# Altium schematic sheet Sensor-Sheet.SchDoc
size A4; SheetNumber: 4; SheetTotal: 8
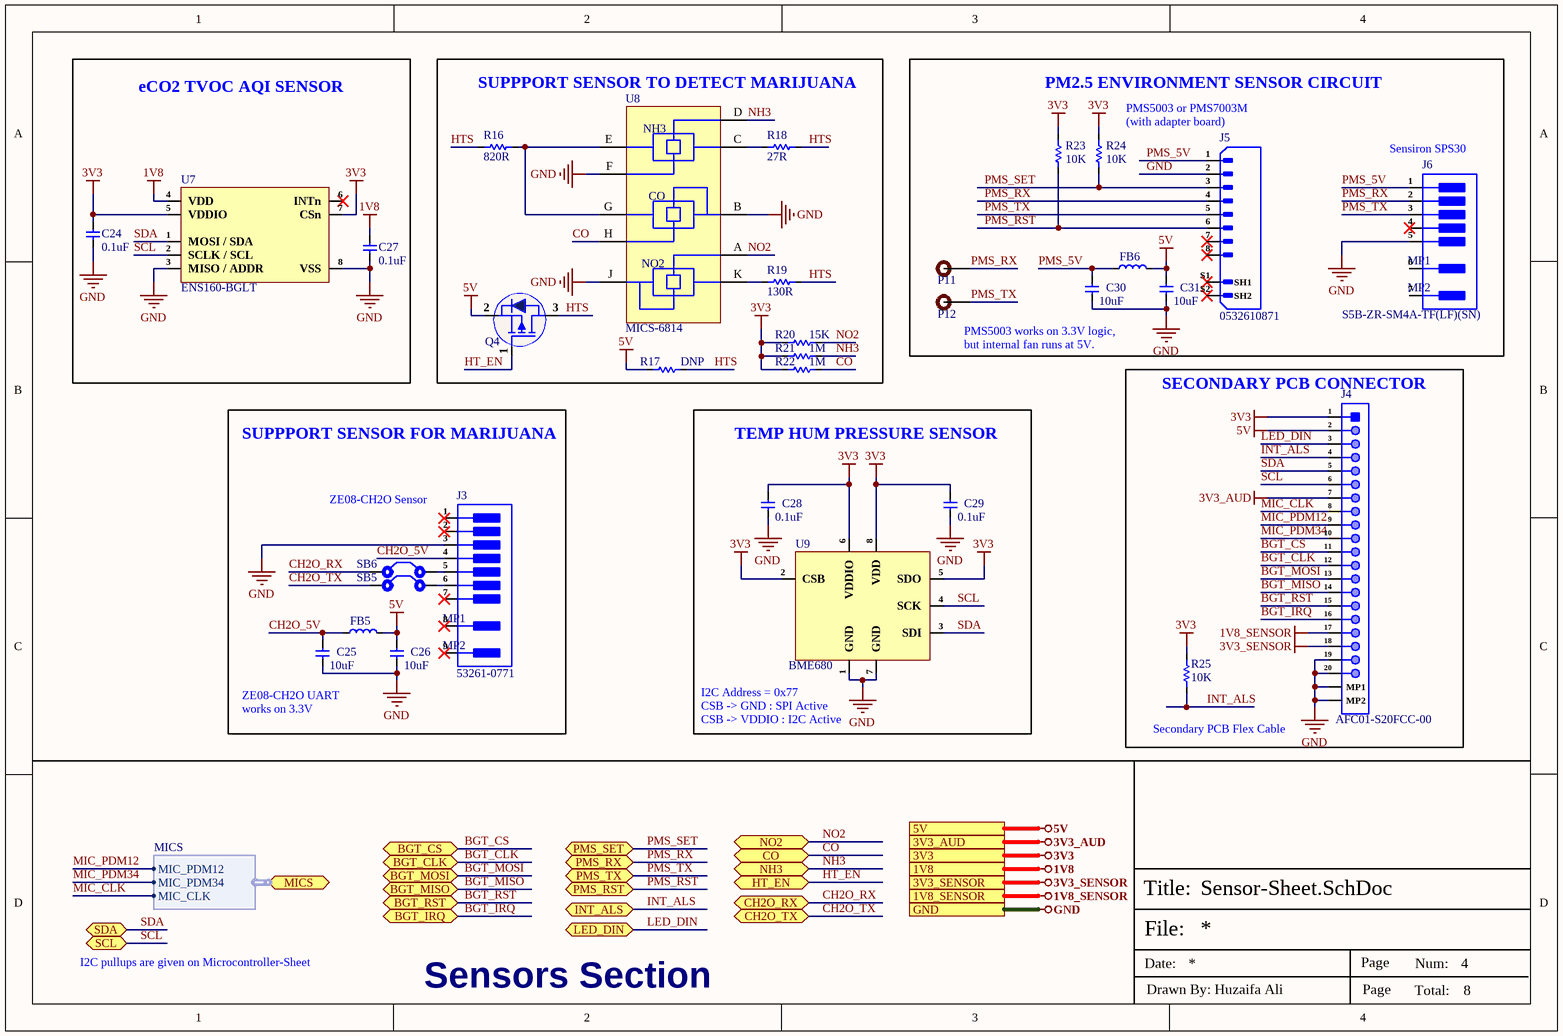
[diagram p0: Sensor-Sheet.SchDoc]

## Parts
C24  0.1uF  [Cap-0402]
C25  10uF  [Cap-0402]
C26  10uF  [Cap-0402]
C27  0.1uF  [Cap-0402]
C28  0.1uF  [Cap-0402]
C29  0.1uF  [Cap-0402]
C30  10uF  [Cap-0402]
C31  10uF  [Cap-0402]
FB5  BLM18SG121TN1D  [IND-0603 (1608 Metric)]  (value not drawn)
FB6  BLM18SG121TN1D  [IND-0603 (1608 Metric)]  (value not drawn)
J3  53261-0771  [53261-0771]
J4  AFC01-S20FCC-00  [AFC01-S20FCC-00]
J5  0532610871  [53261-0871]
J6  S5B-ZR-SM4A-TF(LF)(SN)  [S5B-ZR-SM4A-TF(LF)(SN)]
P11  TEST POINT  [Test-point]  (value not drawn)
P12  TEST POINT  [Test-point]  (value not drawn)
Q4  WPM2015-3/TR  [Sot-23]  (value not drawn)
R16  820R  [Res-0603]
R17  DNP  [Res-0603]
R18  27R  [Res-0603]
R19  130R  [Res-0603]
R20  15K  [Res-0603]
R21  1M  [Res-0603]
R22  1M  [Res-0603]
R23  10K  [Res-0402]
R24  10K  [Res-0402]
R25  10K  [Res-0402]
SB5  Solder Bridge 0402  [Solder Bridge 0402]  (value not drawn)
SB6  Solder Bridge 0402  [Solder Bridge 0402]  (value not drawn)
U7  ENS160-BGLT  [ENS160-BGLT]
U8  MICS-6814  [MICS-6814]
U9  BME680  [BME680]

## Blocks framed on the sheet
eCO2 TVOC AQI SENSOR: C24 C27 U7
SUPPPORT SENSOR TO DETECT MARIJUANA: Q4 R16-R22 U8
PM2.5 ENVIRONMENT SENSOR CIRCUIT: C30 C31 FB6 J5 J6 P11 P12 R23 R24
SUPPPORT SENSOR FOR MARIJUANA: C25 C26 FB5 J3 SB5 SB6
TEMP HUM PRESSURE SENSOR: C28 C29 U9
SECONDARY PCB CONNECTOR: J4 R25

## Ports
1V8, 1V8_SENSOR, 3V3, 3V3_AUD, 3V3_SENSOR, 5V, BGT_CLK (bidir), BGT_CS (bidir), BGT_IRQ (bidir), BGT_MISO (bidir), BGT_MOSI (bidir), BGT_RST (bidir), CH2O_RX (bidir), CH2O_TX (bidir), CO (bidir), GND, HT_EN (bidir), INT_ALS (bidir), LED_DIN (bidir), MICS (bidir, harness MICS), NH3 (bidir), NO2 (bidir), PMS_RST (bidir), PMS_RX (bidir), PMS_SET (bidir), PMS_TX (bidir), SCL (bidir), SDA (bidir)

## Harnesses
MICS: MIC_PDM12, MIC_CLK, MIC_PDM34

## Nets
1V8: C27.1 U7.4(VDD) ; port 1V8
1V8_SENSOR: J4.17 ; port 1V8_SENSOR
3V3: C24.1 C28.2 C29.2 J4.1 R20.1 R21.1 R22.1 R23.2 R24.2 R25.2 U7.5(VDDIO) U7.7(CSn) U9.2(CSB) U9.5(SDO) U9.6(VDDIO) U9.8(VDD) ; port 3V3
3V3_AUD: J4.7 ; port 3V3_AUD
3V3_SENSOR: J4.18 ; port 3V3_SENSOR
5V: C26.2 C31.2 FB5.2 FB6.2 J4.2 Q4.2(S) R17.1 ; port 5V
GND: C24.2 C25.1 C26.1 C27.2 C28.1 C29.1 C30.1 C31.1 J3.3 J4.19 J4.20 J4.MP1 J4.MP2 J5.2 J6.5 U7.3(MISO_/_ADDR) U7.8(VSS) U8.B(Rh1_RED/Rs1_RED) U8.F(Rs2_NH3) U8.J(Rh1_OX/Rs1_OX) U9.1(GND) U9.7(GND) ; port GND
BGT_CLK: J4.12 ; port BGT_CLK
BGT_CS: J4.11 ; port BGT_CS
BGT_IRQ: J4.16 ; port BGT_IRQ
BGT_MISO: J4.14 ; port BGT_MISO
BGT_MOSI: J4.13 ; port BGT_MOSI
BGT_RST: J4.15 ; port BGT_RST
CH2O_5V: C25.2 FB5.1 J3.4
CH2O_RX: SB6.1 ; port CH2O_RX
CH2O_TX: SB5.1 ; port CH2O_TX
CO: R22.2 U8.H(Rs2_RED) ; port CO
HT_EN: Q4.1(G) ; port HT_EN
HTS: Q4.3(D) R16.1 R17.2 R18.2 R19.2
INT_ALS: J4.4 R25.1 ; port INT_ALS
LED_DIN: J4.3 ; port LED_DIN
MIC_CLK: J4.8 ; port MICS.MIC_CLK
MIC_PDM12: J4.9 ; port MICS.MIC_PDM12
MIC_PDM34: J4.10 ; port MICS.MIC_PDM34
NH3: R21.2 U8.D(Rs1_NH3) ; port NH3
NO2: R20.2 U8.A(Rs2) ; port NO2
PMS_5V: C30.2 FB6.1 J5.1 J6.1
PMS_RST: J5.6 R23.1 ; port PMS_RST
PMS_RX: J5.4 J6.2 P11.1 ; port PMS_RX
PMS_SET: J5.3 R24.1 ; port PMS_SET
PMS_TX: J5.5 J6.3 P12.1 ; port PMS_TX
SCL: J4.6 U7.2(SCLK_/_SCL) U9.4(SCK) ; port SCL
SDA: J4.5 U7.1(MOSI_/_SDA) U9.3(SDI) ; port SDA
NetJ3_5: J3.5 SB6.2
NetJ3_6: J3.6 SB5.2
NetR16_2: R16.2 U8.E(Rh2_NH3) U8.G(Rh2_RED)
NetR18_1: R18.1 U8.C(Rh1_NH3)
NetR19_1: R19.1 U8.K(Rh2_OX)

Not connected (* = marked no-connect by the designer): J3 1* 2* 7* 8(MP1)* 9(MP2)*; J5 7* 8* S1(SH1)* S2(SH2)*; J6 4* 6(MP1) 7(MP2); U7 6(INTn)*

## Notes on the sheet
- PMS5003 or PMS7003M (with adapter board)
- (near J6) Sensiron SPS30
- PMS5003 works on 3.3V logic, but internal fan runs at 5V.
- (near J3) ZE08-CH2O Sensor
- (near C25) ZE08-CH2O UART works on 3.3V
- (near U9) CSB -> GND : SPI Active
- (near U9) I2C Address = 0x77
- CSB -> VDDIO : I2C Active
- (near R25) Secondary PCB Flex Cable
- I2C pullups are given on Microcontroller-Sheet
- Sensors Section
- File:
- Title:
- Date:
- Page
- Num:
- Total:
- Drawn By: Huzaifa Ali
- (in symbol MICS-6814) NH3; CO; NO2

## Library data of the parts
C24 C27-C29 = C1005X5R1H104K050BB: CAP CER 0.1UF 50V X5R 0402; Manufacturer: TDK; Dielectric Material: Ceramic; Capacitance: 100nF; Tolerance: 10%; Supplier 1: Digi-Key; Manufacturer Part Number: C1005X5R1H104K050BB; Stock 1: 1455182; Pricing 1: 1=0.12, 10=0.09, 50=0.049, 100=0.04, 500=0.02858, 1000=0.02245, 2500=0.02041, 5000=0.01878 (USD); Mount: Surface Mount; Case/Package: 0402; Case Code (Metric): 1005; Case Code (Imperial): 0402; Weight: 2.3E-05oz; Min Operating Temperature: -55°C; Max Operating Temperature: 85°C; Dielectric: X5R; Voltage Rating: 50V; Packaging: Tape and Reel; Voltage Rating (DC): 50V; Termination: SMD/SMT; Construction: Flat; Package Quantity: 1; Resistor Type: Ceramic; Voltage: 50V; Series: C; Length: 1mm; Width: 0.02inch; Height: 0.5mm; Depth: 0.5mm; Thickness: 0.022inch; Radiation Hardening: No; Lead Free: Lead Free; REACH SVHC: No SVHC; RoHS Compliant: Yes; ComponentLink1URL: https://product.tdk.com/info/en/catalog/spec/mlccspec_commercial_general_midvoltage_en.pdf?src-supplier=Digi-Key; ComponentLink1Description: https://product.tdk.com/info/en/catalog/spec/mlccspec_commercial_general_midvoltage_en.pdf?src-supplier=Digi-Key; ComponentLink2URL: http://www.tdk.co.jp/tefe02/e413_c.pdf?src-supplier=Future+Electronics; ComponentLink2Description: http://www.tdk.co.jp/tefe02/e413_c.pdf?src-supplier=Future+Electronics; ComponentLink3URL: https://www.verical.com/server-webapp/html/getDatasheet?partID=743571&src-supplier=Verical; ComponentLink3Description: https://www.verical.com/server-webapp/html/getDatasheet?partID=743571&src-supplier=Verical; ComponentLink4URL: http://www.tdk.co.jp/tefe02/e412_c.pdf?src-supplier=Avnet+Europe; ComponentLink4Description: http://www.tdk.co.jp/tefe02/e412_c.pdf?src-supplier=Avnet+Europe; Supplier Part Number 1: 445-5942-1-ND; LCSC Part Number: C2181865
C25 C26 C30 C31 = CC0402MRX5R6BB106: CAP CER 10UF 10V X5R 0402; Manufacturer: Yageo; Tolerance: 20%; Item Type: Capacitor; Supplier 1: Future Electronics; Manufacturer Part Number: CC0402MRX5R6BB106; RoHS: Yes; Category: Ceramic Capacitors; Stock 1: 80000; Pricing 1: 10000=0.02650, 20000=0.02590, 30000=0.02550, 40000=0.02530, 50000=0.02450 (USD); Mount: Surface Mount; Case/Package: 0402; Case Code (Imperial): 0402; Case Code (Metric): 1005; Min Operating Temperature: -55°C; Max Operating Temperature: 85°C; Packaging: Tape and Reel; Capacitance: 10uF; Voltage Rating: 10V; RoHS Compliant: Yes; ComponentLink1URL: http://www.yageo.com/documents/recent/UPY-GPHC_X5R_4V-to-50V_25.pdf?src-supplier=Digi-Key; ComponentLink1Description: http://www.yageo.com/documents/recent/UPY-GPHC_X5R_4V-to-50V_25.pdf?src-supplier=Digi-Key; Supplier Part Number 1: 6097631; LCSC Part Number: C962143
FB5 FB6 = BLM18SG121TN1D: FERRITE BEAD 120 OHM 0603 1LN; Manufacturer: Murata; Material: Steel,Ferrite; Tolerance: 25%; Impedance: 120R; DC Resistance (DCR): 25mR; Max DC Current: 3A; Number of Lines: 1; Test Frequency: 100MHz; Shielding: Unshielded; Supplier 1: Arrow Electronics; Manufacturer Part Number: BLM18SG121TN1D; RoHS: Yes; Category: Ferrite Beads and Chips; Stock 1: 82612; Pricing 1: 1=0.12640, 10=0.08350, 25=0.07210, 100=0.05150, 250=0.04730, 500=0.04110, 1000=0.03420, 3000=0.03360, 6000=0.03320, 15000=0.03270, 30000=0.03200, 75000=0.03150 (USD); Case/Package: 0603; Number of Pins: 2; Core Material: Ferrite; Case Code (Metric): 1608; Case Code (Imperial): 0603; Min Operating Temperature: -55°C; Max Operating Temperature: 125°C; Package Quantity: 1; Max Current Rating: 3A; Packaging: Tape and Reel; Current Rating: 3A; Termination: SMD/SMT; Frequency: 100MHz; Number of Circuits: 1; Series: BLM18S; DC Resistance-Max: 25mR; Length: 1.6mm; Width: 0.8mm; Height: 0.8mm; Depth: 0.8mm; Reach SVHC Compliant: Yes; Lead Free: Lead Free; RoHS Compliant: Yes; ComponentLink1URL: https://datasheet.ciiva.com/1012/l0110s0100blm18s-1012624.pdf?src-supplier=Digi-Key; ComponentLink1Description: https://datasheet.ciiva.com/1012/l0110s0100blm18s-1012624.pdf?src-supplier=Digi-Key; ComponentLink2URL: https://datasheet.ciiva.com/11799/0900766b811b5866-11799181.pdf?src-supplier=RSComponents; ComponentLink2Description: https://datasheet.ciiva.com/11799/0900766b811b5866-11799181.pdf?src-supplier=RSComponents; ComponentLink3URL: https://datasheet.ciiva.com/18093/getdatasheetpartid-295885-18093249.pdf?src-supplier=Verical; ComponentLink3Description: https://datasheet.ciiva.com/18093/getdatasheetpartid-295885-18093249.pdf?src-supplier=Verical; ComponentLink4URL: https://datasheet.ciiva.com/41449/001171723-da-01-en-chip-drossel0603-120r-3000ma-1-6x0-8mm-41449353.pdf?src-supplier=Conrad; ComponentLink4Description: https://datasheet.ciiva.com/41449/001171723-da-01-en-chip-drossel0603-120r-3000ma-1-6x0-8mm-41449353.pdf?src-supplier=Conrad; ComponentLink5URL: https://datasheet.ciiva.com/41449/001172312-da-01-en-drossel-0603-120r-1-6x0-8mm-10000st-41449675.pdf?src-supplier=Conrad; ComponentLink5Description: https://datasheet.ciiva.com/41449/001172312-da-01-en-drossel-0603-120r-1-6x0-8mm-10000st-41449675.pdf?src-supplier=Conrad; ComponentLink6URL: https://datasheet.ciiva.com/8021/5151-8021511.pdf?src-supplier=Element14; ComponentLink6Description: https://datasheet.ciiva.com/8021/5151-8021511.pdf?src-supplier=Element14; ComponentLink7URL: https://datasheet.ciiva.com/8021/5151-8021512.pdf?src-supplier=Element14; ComponentLink7Description: https://datasheet.ciiva.com/8021/5151-8021512.pdf?src-supplier=Element14; ComponentLink8URL: https://datasheet.ciiva.com/14122/blm-series-eng-tds-14122906.pdf?src-supplier=Distrelec; ComponentLink8Description: https://datasheet.ciiva.com/14122/blm-series-eng-tds-14122906.pdf?src-supplier=Distrelec; ComponentLink9URL: https://datasheet.ciiva.com/1012/l0110s0100blm18s-1012623.pdf?src-supplier=Digi-Key; ComponentLink9Description: https://datasheet.ciiva.com/1012/l0110s0100blm18s-1012623.pdf?src-supplier=Digi-Key; ComponentLink10URL: https://datasheet.ciiva.com/1012/l0110s0100blm18s-1012625.pdf?src-supplier=Digi-Key; ComponentLink10Description: https://datasheet.ciiva.com/1012/l0110s0100blm18s-1012625.pdf?src-supplier=Digi-Key; ComponentLink11URL: https://datasheet.ciiva.com/16395/l0110s0100blm18s-16395498.pdf?src-supplier=Future+Electronics; ComponentLink11Description: https://datasheet.ciiva.com/16395/l0110s0100blm18s-16395498.pdf?src-supplier=Future+Electronics; Supplier Part Number 1: BLM18SG121TN1D; LCSC Part Number: C113030; Item Type: Ferrite Bead
J3 = 53261-0771: CONN HEADER SMD R/A 7POS 1.25MM; Manufacturer: Molex; Body Plating: Tin; Contact Resistance: 20mR; Number of Contacts: 7; Current Rating: 1A; Voltage Rating: 125V; Insulation Resistance: 100MR; Item Type: Wire To Wire Connector; Supplier 1: Mouser; Manufacturer Part Number: 53261-0771; RoHS: Yes; Category: Headers and Wire Housings; Stock 1: 27199; Pricing 1: 1=0.83, 10=0.688, 50=0.688, 100=0.574, 1000=0.504, 10000=0.419 (USD); Mounting Technology: Surface Mount; Color: Natural; Contact Plating: Tin; Contact Material: Bronze,Brass,Tin; Housing Color: Natural; Housing Material: Nylon; Min Operating Temperature: -40°C; Max Operating Temperature: 85°C; Packaging: Tape and Reel; Termination: Solder; Orientation: Right Angle; Series: PicoBlade; Number of Rows: 1; Number of Positions: 7; Contact Type: Blade Pin; Contact Gender: Male; Voltage Rating (AC): 125V; Working Voltage: 125V; Length: 13.9mm; Pitch: 1.25mm; Lead Pitch: 1.25mm; Depth: 5.2mm; RoHS Compliant: Yes; Flammability Rating: UL94 V-0; Reach SVHC Compliant: Unknown; ComponentLink1URL: https://datasheet.ciiva.com/392/532610371-sd-392113.pdf?src-supplier=Digi-Key; ComponentLink1Description: https://datasheet.ciiva.com/392/532610371-sd-392113.pdf?src-supplier=Digi-Key; ComponentLink2URL: https://datasheet.ciiva.com/11747/0900766b8078fc7d-11747893.pdf?src-supplier=Rs; ComponentLink2Description: https://datasheet.ciiva.com/11747/0900766b8078fc7d-11747893.pdf?src-supplier=Rs; ComponentLink3URL: https://datasheet.ciiva.com/392/532610771-sd-392145.pdf?src-supplier=Digi-Key; ComponentLink3Description: https://datasheet.ciiva.com/392/532610771-sd-392145.pdf?src-supplier=Digi-Key; ComponentLink4URL: https://datasheet.ciiva.com/392/532610771-sd-392146.pdf?src-supplier=Digi-Key; ComponentLink4Description: https://datasheet.ciiva.com/392/532610771-sd-392146.pdf?src-supplier=Digi-Key; Supplier Part Number 1: 538-53261-0771; LCSC Part Number: C505276
J4 = AFC01-S20FCC-00: Clamshell 20P Bottom Contact Surface Mount 0.5mm SMD,P=0.5mm FFC/FPC Connectors ROHS; Manufacturer: JUSHUO; Manufacturer Part Number: AFC01-S20FCC-00; Package: SMD,P=0.5mm; LCSC Part Number: C262274; ComponentLink1Description: LCSC; ComponentLink1URL: https://www.lcsc.com/product-detail/FFC-FPC-Connectors_JUSHUO-AFC01-S20FCC-00_C262274.html; Item Type: FPC Connector
J5 = 0532610871: CONN HEADER SMD R/A 8POS 1.25MM; Manufacturer: Molex; Contact Resistance: 20mR; Current Rating: 1A; Voltage Rating: 125V; Number of Positions: 8; Insulation Resistance: 100MR; Gender: Male; Glow Wire Compliant: Non-compliant; Item Type: R/A Male Blade Header; Supplier 1: Mouser; Manufacturer Part Number: 53261-0871; RoHS: Yes; Category: Headers and Wire Housings; Stock 1: 34151; Pricing 1: 1=0.89, 10=0.735, 50=0.735, 100=0.609, 1000=0.482, 10000=0.393 (USD); Mounting Technology: Surface Mount; Contact Material: Bronze,Brass,Tin; Contact Plating: Tin; Color: Natural; Housing Material: Nylon; Contact Shape: Rectangular; Contact Finish - Mating: TIN; Insulation Material: Nylon; Insulation Color: Natural; Housing Color: Natural; Min Operating Temperature: -40°C; Max Operating Temperature: 85°C; Number of Rows: 1; Voltage Rating (AC): 125V; Packaging: Tape and Reel; Package Quantity: 1000; Termination: Solder; Number of Contacts: 8; Working Voltage: 125V; Orientation: Right Angle; Number of Circuits: 8; Voltage Rating (DC): 125V; Connector Type: Header; Fastening Type: Detent; Series: PicoBlade; Contact Type: Male Blade; Lead Pitch: 1.25mm; Pitch: 1.25mm; Depth: 5.2mm; Radiation Hardening: No; Lead Free: Lead Free; Flammability Rating: UL94 V-0; RoHS Compliant: Yes; Reach SVHC Compliant: Unknown; Supplier Part Number 1: 538-53261-0871; LCSC Part Number: *
J6 = S5B-ZR-SM4A-TF(LF)(SN): CONN HEADER SMD R/A 5POS 1.5MM; Manufacturer: JST; Contact Resistance: 30mR; Max Current Rating: 1A; Voltage Rating: 50V; Number of Positions: 5; Gender: Male; Item Type: Wire to Wire Connector; Supplier 1: Arrow Electronics; Manufacturer Part Number: S5B-ZR-SM4A-TF(LF)(SN); RoHS: Yes; Category: Headers and Wire Housings; Stock 1: 66000; Pricing 1: 1000=0.3882, 2000=0.3767, 3000=0.3536, 5000=0.3417, 10000=0.3075, 50000=0.3045 (USD); Mounting Technology: Surface Mount; Color: Natural; Contact Material: Brass,Tin; Contact Plating: Tin,Copper; Housing Color: Beige; Housing Material: Polyamide; Contact Shape: Circular; Contact Finish - Mating: TIN; Insulation Material: Nylon; Insulation Color: Natural; Min Operating Temperature: -25°C; Max Operating Temperature: 85°C; Number of Rows: 1; Packaging: Tape and Reel; Current Rating: 1A; Termination: Solder; Fastening Type: Detent; Max Voltage Rating (AC): 50V; Number of Contacts: 5; Orientation: Right Angle; Connector Type: Header; Series: ZH; Contact Type: Male Pin; Length: 10.5mm; Width: 3.5mm; Height: 7.2mm; Pitch: 1.5mm; Depth: 6.5mm; Lead Free: Lead Free; Flammability Rating: UL94 V-0; Reach SVHC Compliant: Unknown; ComponentLink1URL: https://datasheet.ciiva.com/26924/getdatasheetpartid-640788-26924051.pdf?src-supplier=Verical; ComponentLink1Description: https://datasheet.ciiva.com/26924/getdatasheetpartid-640788-26924051.pdf?src-supplier=Verical; ComponentLink2URL: https://datasheet.ciiva.com/712/ezh-712574.pdf?src-supplier=Digi-Key; ComponentLink2Description: https://datasheet.ciiva.com/712/ezh-712574.pdf?src-supplier=Digi-Key; ComponentLink3URL: https://datasheet.ciiva.com/712/ezh-712575.pdf?src-supplier=Digi-Key; ComponentLink3Description: https://datasheet.ciiva.com/712/ezh-712575.pdf?src-supplier=Digi-Key; ComponentLink4URL: https://datasheet.ciiva.com/712/ezh-712576.pdf?src-supplier=Digi-Key; ComponentLink4Description: https://datasheet.ciiva.com/712/ezh-712576.pdf?src-supplier=Digi-Key; ComponentLink5URL: https://datasheet.ciiva.com/16484/ezr-16484588.pdf?src-supplier=Future+Electronics; ComponentLink5Description: https://datasheet.ciiva.com/16484/ezr-16484588.pdf?src-supplier=Future+Electronics; ComponentLink6URL: https://datasheet.ciiva.com/46409/1718812-46409350.pdf?src-supplier=Element14; ComponentLink6Description: https://datasheet.ciiva.com/46409/1718812-46409350.pdf?src-supplier=Element14; ComponentLink7URL: https://datasheet.ciiva.com/46409/1718812-46409351.pdf?src-supplier=Element14; ComponentLink7Description: https://datasheet.ciiva.com/46409/1718812-46409351.pdf?src-supplier=Element14; Supplier Part Number 1: S5B-ZR-SM4A-TF(LF)(SN); LCSC Part Number: C485355
P11 P12 = TEST POINT: Test Point ON; Item Type: TEST POINT
Q4 = WPM2015-3/TR: 20V 2.2A 800mW 110mΩ@4.5V,2.7A 810mV@250uA P Channel SOT-23 MOSFETs ROHS; Manufacturer: WILLSEMI; Item Type: Mosfet; Manufacturer Part Number: WPM2015-3/TR; Package: SOT-23; LCSC Part Number: C213159; ComponentLink1Description: LCSC; ComponentLink1URL: https://www.lcsc.com/product-detail/MOSFETs_WILLSEMI-Will-Semicon-WPM2015-3-TR_C213159.html
R16 = RC0603FR-07820RL: RES 820 OHM 1% 1/10W 0603; Manufacturer: Yageo; Power Rating: 100mW; Voltage Rating: 75V; Voltage Rating (DC): 50V; Temperature Coefficient: 100ppm/°C; Item Type: Resistor; Supplier 1: Future Electronics; Manufacturer Part Number: RC0603FR-07820RL; RoHS: Yes; Category: Chip SMD Resistors; Stock 1: 415000; Pricing 1: 5000=0.002, 50000=0.0014, 100000=0.0018, 200000=0.0014, 375000=0.0018, 625000=0.0013, 1000000=0.0017, 2000000=0.0012, 3750000=0.0016 (USD); Case/Package: 0603; Pins: 2; Case Code (Imperial): 0603; Case Code (Metric): 1608; Weight: 7.1E-05oz; Min Operating Temperature: -55°C; Max Operating Temperature: 155°C; Tolerance: 1%; Value: 820R; Packaging: Tape and Reel; Termination: SMD/SMT; Resistor Type: Thick Film; Features: Moisture Resistant; Series: RC; Max Power Dissipation: 100mW; Number of Terminations: 2; Construction: Rectangular; Resistance Tolerance: 1%; Technology: THICK FILM; Length: 1.6mm; Width: 0.8mm; Height: 0.45mm; Depth: 0.8mm; Military Standard: Not; Lead Free: Lead Free; RoHS Compliant: Yes; Reach SVHC Compliant: Unknown; ComponentLink1URL: http://www.farnell.com/datasheets/1868787.pdf?src-supplier=Farnell; ComponentLink1Description: http://www.farnell.com/datasheets/1868787.pdf?src-supplier=Farnell; ComponentLink2URL: http://www.mouser.com/ds/2/447/RC0603-272842.pdf?src-supplier=Mouser; ComponentLink2Description: http://www.mouser.com/ds/2/447/RC0603-272842.pdf?src-supplier=Mouser; ComponentLink3URL: http://www.farnell.com/datasheets/2167052.pdf?src-supplier=Farnell; ComponentLink3Description: http://www.farnell.com/datasheets/2167052.pdf?src-supplier=Farnell; ComponentLink4URL: https://www.verical.com/server-webapp/html/getDatasheet?partID=358925&src-supplier=Verical; ComponentLink4Description: https://www.verical.com/server-webapp/html/getDatasheet?partID=358925&src-supplier=Verical; ComponentLink5URL: http://www.farnell.com/datasheets/1868787.pdf?src-supplier=Newark; ComponentLink5Description: http://www.farnell.com/datasheets/1868787.pdf?src-supplier=Newark; ComponentLink6URL: http://www.farnell.com/datasheets/1868787.pdf?src-supplier=Element14; ComponentLink6Description: http://www.farnell.com/datasheets/1868787.pdf?src-supplier=Element14; ComponentLink7URL: http://www.yageo.com/documents/recent/PYu-RC_Group_51_RoHS_L_10.pdf?src-supplier=Digi-Key; ComponentLink7Description: http://www.yageo.com/documents/recent/PYu-RC_Group_51_RoHS_L_10.pdf?src-supplier=Digi-Key; ComponentLink8URL: http://www.yageo.com/documents/recent/PYu-RC_Group_51_RoHS_L_9.pdf?src-supplier=Digi-Key; ComponentLink8Description: http://www.yageo.com/documents/recent/PYu-RC_Group_51_RoHS_L_9.pdf?src-supplier=Digi-Key; ComponentLink9URL: http://www.farnell.com/datasheets/2167052.pdf?src-supplier=Newark; ComponentLink9Description: http://www.farnell.com/datasheets/2167052.pdf?src-supplier=Newark; ComponentLink10URL: http://www.yageo.com/documents/recent/PYu-RC0603_51_RoHS_L_7.pdf?src-supplier=Future+Electronics; ComponentLink10Description: http://www.yageo.com/documents/recent/PYu-RC0603_51_RoHS_L_7.pdf?src-supplier=Future+Electronics; Supplier Part Number 1: 8621260; LCSC Part Number: C114638
R17 = RC0603FR-070RL: RES SMD 0R, 1%, 0.1W, 0603; Manufacturer: Yageo; Item Type: Resistor; Manufacturer Part Number: RC0603FR-070RL; Package: 0603; LCSC Part Number: C100044; ComponentLink9Description: LCSC; ComponentLink9URL: https://www.lcsc.com/product-detail/Chip-Resistor-Surface-Mount_YAGEO-RC0603FR-070RL_C100044.html
R18 = RC0603FR-0727RL: RES 27 OHM 1% 1/10W 0603; Manufacturer: Yageo; Voltage Rating (DC): 50V; Temperature Coefficient: 100ppm/°C; Power Rating: 100mW; Item Type: Resistor; Supplier 1: Future Electronics; Manufacturer Part Number: RC0603FR-0727RL; RoHS: Yes; Category: Chip SMD Resistors; Stock 1: 285000; Pricing 1: 5000=0.0015, 50000=0.0014, 200000=0.0014, 625000=0.0013, 2000000=0.0012 (USD); Case/Package: 0603; Pins: 2; Case Code (Metric): 1608; Case Code (Imperial): 0603; Min Operating Temperature: -55°C; Max Operating Temperature: 155°C; Value: 27R; Tolerance: 1%; Packaging: Tape and Reel; Resistor Type: Thick Film; Number of Terminations: 2; Voltage Rating: 50V; Termination: SMD/SMT; Max Power Dissipation: 100mW; Features: Moisture Resistant; Series: RC; Resistance Tolerance: 1%; Width: 0.8mm; Lead Free: Lead Free; Reach SVHC Compliant: Unknown; RoHS Compliant: Yes; ComponentLink1URL: https://datasheet.ciiva.com/2454/pyu-r-int-thick-7-2454031.pdf?src-supplier=Digi-Key; ComponentLink1Description: https://datasheet.ciiva.com/2454/pyu-r-int-thick-7-2454031.pdf?src-supplier=Digi-Key; ComponentLink2URL: https://datasheet.ciiva.com/2454/pyu-r-int-thick-7-2454032.pdf?src-supplier=Digi-Key; ComponentLink2Description: https://datasheet.ciiva.com/2454/pyu-r-int-thick-7-2454032.pdf?src-supplier=Digi-Key; ComponentLink3URL: https://datasheet.ciiva.com/2454/pyu-r-int-thick-7-2454030.pdf?src-supplier=Digi-Key; ComponentLink3Description: https://datasheet.ciiva.com/2454/pyu-r-int-thick-7-2454030.pdf?src-supplier=Digi-Key; ComponentLink4URL: https://datasheet.ciiva.com/7746/443971-7746313.pdf?src-supplier=Element14; ComponentLink4Description: https://datasheet.ciiva.com/7746/443971-7746313.pdf?src-supplier=Element14; ComponentLink5URL: https://datasheet.ciiva.com/7746/443971-7746314.pdf?src-supplier=Element14; ComponentLink5Description: https://datasheet.ciiva.com/7746/443971-7746314.pdf?src-supplier=Element14; Supplier Part Number 1: 9798455; LCSC Part Number: C137753
R19 = RC0603FR-07130RL: RES 130 OHM 1% 1/10W 0603; Manufacturer: Yageo; Power Rating: 100mW; Temperature Coefficient: 100ppm/°C; Voltage Rating (DC): 50V; Voltage Rating: 75V; Item Type: Resistor; Supplier 1: Future Electronics; Manufacturer Part Number: RC0603FR-07130RL; RoHS: Yes; Category: Chip SMD Resistors; Stock 1: 630000; Pricing 1: 5000=0.0014, 75000=0.0013, 200000=0.0013, 750000=0.0012, 2000000=0.0011 (USD); Case/Package: 0603; Pins: 2; Case Code (Imperial): 0603; Case Code (Metric): 1608; Weight: 7.1E-05oz; Min Operating Temperature: -55°C; Max Operating Temperature: 155°C; Value: 130R; Tolerance: 1%; Packaging: Tape and Reel; Resistor Type: Thick Film; Termination: SMD/SMT; Number of Terminations: 2; Max Power Dissipation: 100mW; Features: Moisture Resistant; Series: RC; Resistance Tolerance: 1%; Construction: Rectangular; Length: 1.6mm; Width: 0.8mm; Height: 0.45mm; Depth: 0.8mm; Lead Free: Lead Free; Reach SVHC Compliant: No; Military Standard: Not; RoHS Compliant: Yes; ComponentLink1URL: https://datasheet.ciiva.com/46395/443971-46395023.pdf?src-supplier=Element14; ComponentLink1Description: https://datasheet.ciiva.com/46395/443971-46395023.pdf?src-supplier=Element14; ComponentLink2URL: https://datasheet.ciiva.com/2553/pyu-r-int-thick-7-2553516.pdf?src-supplier=Digi-Key; ComponentLink2Description: https://datasheet.ciiva.com/2553/pyu-r-int-thick-7-2553516.pdf?src-supplier=Digi-Key; ComponentLink3URL: https://datasheet.ciiva.com/2553/pyu-r-int-thick-7-2553517.pdf?src-supplier=Digi-Key; ComponentLink3Description: https://datasheet.ciiva.com/2553/pyu-r-int-thick-7-2553517.pdf?src-supplier=Digi-Key; ComponentLink4URL: https://datasheet.ciiva.com/2553/pyu-r-int-thick-7-2553515.pdf?src-supplier=Digi-Key; ComponentLink4Description: https://datasheet.ciiva.com/2553/pyu-r-int-thick-7-2553515.pdf?src-supplier=Digi-Key; Supplier Part Number 1: 1846773; LCSC Part Number: C141677
R20 = RC0603FR-0715KL: RES 15K OHM 1% 1/10W 0603; Manufacturer: Yageo; Temperature Coefficient: 100ppm/°C; Value: 15kR; Power Rating: 100mW; Voltage Rating (DC): 50V; Item Type: Resistor; Supplier 1: Future Electronics; Manufacturer Part Number: RC0603FR-0715KL; RoHS: Yes; Category: Chip SMD Resistors; Stock 1: 13310000; Pricing 1: 5000=0.00150, 50000=0.00140, 100000=0.00140, 200000=0.00140, 375000=0.00140, 625000=0.00130, 1000000=0.00130, 2000000=0.00120, 3750000=0.00120 (USD); Case/Package: 0603; Pins: 2; Case Code (Metric): 1608; Case Code (Imperial): 0603; Min Operating Temperature: -55°C; Max Operating Temperature: 155°C; Tolerance: 1%; Packaging: Tape and Reel; Resistor Type: Thick Film; Series: RC; Package Quantity: 1; Voltage Rating: 50V; Number of Terminations: 2; Termination: SMD/SMT; Max Power Dissipation: 100mW; Features: Moisture Resistant; Resistance Tolerance: 1%; Construction: Rectangular; Length: 0.063inch; Width: 0.031inch; Height: 0.022inch; Depth: 0.8mm; Lead Free: Lead Free; RoHS Compliant: Yes; Military Standard: Not; Supplier Part Number 1: 4083945; LCSC Part Number: C114661
R21 R22 = RC0603FR-071ML: RES SMD 1M OHM 1% 1/10W 0603; Manufacturer: Yageo; Voltage Rating: 50V; Resistance: 1MR; Power Rating: 100mW; Temperature Coefficient: 100ppm/°C; Supplier 1: Digi-Key; Manufacturer Part Number: RC0603FR-071ML; Stock 1: 3824601; Pricing 1: 1=0.1, 10=0.023, 100=0.0094, 1000=0.00421, 2500=0.00366 (USD); Case/Package: 0603; Number of Pins: 2; Case Code (Imperial): 0603; Case Code (Metric): 1608; Min Operating Temperature: -55°C; Max Operating Temperature: 155°C; Voltage Rating (DC): 50V; Tolerance: 1%; Packaging: Tape and Reel; Package Quantity: 5000; Termination: SMD/SMT; Composition: Thick Film; Military Standard: Not; Length: 1.6mm; Height: 0.45mm; Width: 0.8mm; Depth: 0.8mm; REACH SVHC: No SVHC; Lead Free: Lead Free; ComponentLink1URL: http://www.farnell.com/datasheets/2167052.pdf?src-supplier=Mouser; ComponentLink1Description: http://www.farnell.com/datasheets/2167052.pdf?src-supplier=Mouser; ComponentLink2URL: http://www.farnell.com/datasheets/2167052.pdf?src-supplier=Element14; ComponentLink2Description: http://www.farnell.com/datasheets/2167052.pdf?src-supplier=Element14; ComponentLink3URL: http://documents.rs-components.com/techlib://itc_doclist_GB.htm?stockno=5048956&src-supplier=RSComponents; ComponentLink3Description: http://documents.rs-components.com/techlib://itc_doclist_GB.htm?stockno=5048956&src-supplier=RSComponents; Supplier Part Number 1: 311-1.00MHRDKR-ND; LCSC Part Number: C105578
R23-R25 = RC0402FR-0710KL: RES 10K OHM 1% 1/16W 0402; Manufacturer: Yageo; Resistance: 10kR; Voltage Rating (DC): 50V; Temperature Coefficient: 100ppm/°C; Power Rating: 62.5mW; Max Power Dissipation: 63mW; Item Type: Resistor; Supplier 1: Mouser; Manufacturer Part Number: RC0402FR-0710KL; RoHS: Yes; Category: Chip SMD Resistors; Stock 1: 18648329; Pricing 1: 1=0.10000, 10=0.01400, 50=0.01400, 100=0.00500, 1000=0.00300, 10000=0.00200 (USD); Case/Package: 0402; Number of Pins: 2; Case Code (Imperial): 0402; Case Code (Metric): 1005; Min Operating Temperature: -55°C; Max Operating Temperature: 155°C; Resistor Type: Thick Film; Tolerance: 1%; Packaging: Tape and Reel; Voltage Rating: 50V; Termination: SMD/SMT; Working Voltage: 50V; Number of Terminations: 2; Features: Moisture Resistant; Series: RC; Resistance Tolerance: 1%; Construction: Rectangular; Length: 1mm; Width: 0.5mm; Height: 0.32mm; Depth: 0.5mm; Lead Pitch: 0.2mm; REACH SVHC: No SVHC; Lead Free: Lead Free; RoHS Compliant: Yes; Military Standard: Not; ComponentLink1URL: https://datasheet.ciiva.com/7660/38568-7660787.pdf?src-supplier=Element14; ComponentLink1Description: https://datasheet.ciiva.com/7660/38568-7660787.pdf?src-supplier=Element14; ComponentLink2URL: https://datasheet.ciiva.com/7849/1686128-7849814.pdf?src-supplier=Element14; ComponentLink2Description: https://datasheet.ciiva.com/7849/1686128-7849814.pdf?src-supplier=Element14; ComponentLink3URL: https://datasheet.ciiva.com/7983/1018594-7983486.pdf?src-supplier=Element14; ComponentLink3Description: https://datasheet.ciiva.com/7983/1018594-7983486.pdf?src-supplier=Element14; ComponentLink4URL: https://datasheet.ciiva.com/22747/1018594-22747512.pdf?src-supplier=Element14; ComponentLink4Description: https://datasheet.ciiva.com/22747/1018594-22747512.pdf?src-supplier=Element14; ComponentLink5URL: https://datasheet.ciiva.com/12667/pyu-rc0402-51-rohs-l-6-r-12667067.pdf?src-supplier=Mouser; ComponentLink5Description: https://datasheet.ciiva.com/12667/pyu-rc0402-51-rohs-l-6-r-12667067.pdf?src-supplier=Mouser; ComponentLink6URL: https://datasheet.ciiva.com/7849/1784430-7849813.pdf?src-supplier=Element14; ComponentLink6Description: https://datasheet.ciiva.com/7849/1784430-7849813.pdf?src-supplier=Element14; ComponentLink7URL: https://datasheet.ciiva.com/7849/1784430-7849815.pdf?src-supplier=Element14; ComponentLink7Description: https://datasheet.ciiva.com/7849/1784430-7849815.pdf?src-supplier=Element14; Supplier Part Number 1: 603-RC0402FR-0710KL; LCSC Part Number: C60490
SB5 SB6 = Solder Bridge 0402: Solder Bridge ON; Manufacturer Part Number: Solder Bridge 0402; Item Type: Solder Bridge
U7 = ENS160-BGLT: Digital Metal-Oxide Multi-Gas Sensor; Manufacturer: ScioSense; Supplier 1: Mouser; Manufacturer Part Number: ENS160-BGLT; RoHS: No; Category: Uncategorized; Stock 1: 5978; Pricing 1: 1=12.8, 10=10.46, 50=9.67, 100=8.1, 1000=7.19, 10000=7.19 (USD); Supplier Part Number 1: 135-ENS160-BGLT; LCSC Part Number: C3659333; Item Type: Gas Sensor
U8 = MICS-6814: CO/NO2/NH3 Triple Gas Sensor Metaloxide Gas Detection Sensor SMD T/R; Manufacturer: Amphenol; Item Type: (CO) Sensor; Supplier 1: Arrow Electronics; Manufacturer Part Number: MICS-6814; RoHS: No; Category: Sensors; Stock 1: 100; Pricing 1: 1=10.8025, 10=10.7911 (USD); Supplier Part Number 1: MICS-6814; LCSC Part Number: C3659383
U9 = BME680: SENSOR RH PRESSURE TEMP VOC; Manufacturer: Bosch Sensortec; Sensor Type: Temperature; Output Type: SPI,I2C; Item Type: Temperature Sensor; Supplier 1: Future Electronics; Manufacturer Part Number: BME680; RoHS: No; Category: Uncategorized; Stock 1: 64; Pricing 1: 1=9.84000, 20=8.81000, 125=8.18000, 500=7.71000, 3000=7.09000 (USD); Min Operating Temperature: -40°C; Max Operating Temperature: 85°C; ComponentLink1URL: https://ae-bst.resource.bosch.com/media/_tech/media/application_notes/BST-BME680-HS000-05.pdf?src-supplier=Digi-Key; ComponentLink1Description: https://ae-bst.resource.bosch.com/media/_tech/media/application_notes/BST-BME680-HS000-05.pdf?src-supplier=Digi-Key; ComponentLink2URL: https://ae-bst.resource.bosch.com/media/_tech/media/product_flyer/BST-BME680-FL000.pdf?src-supplier=Digi-Key; ComponentLink2Description: https://ae-bst.resource.bosch.com/media/_tech/media/product_flyer/BST-BME680-FL000.pdf?src-supplier=Digi-Key; Supplier Part Number 1: 7107186; LCSC Part Number: C125972